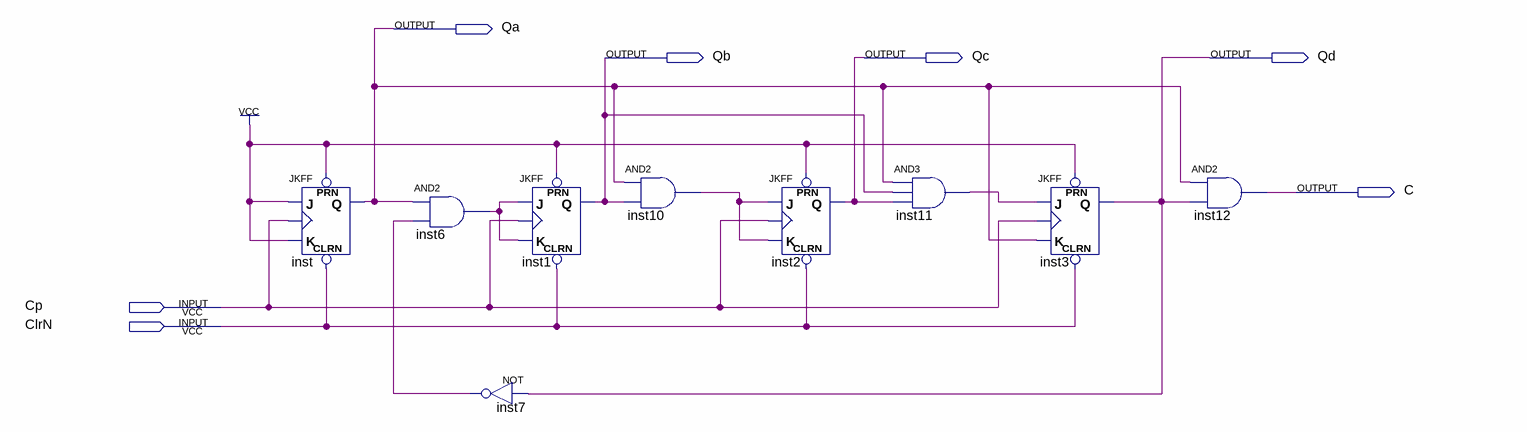
[diagram p0: schematic sheet]
// Quartus schematic BCD_counter.bdf as structural Verilog: 9 symbols, 7 pins
module BCD_counter (
  input  Cp,
  input  ClrN,
  output Qa,
  output Qb,
  output Qc,
  output Qd,
  output C
);

  wire inst6_out, inst7_out, inst10_out, inst11_out;

  JKFF inst (.PRN(1'b1), .CLRN(ClrN), .K(1'b1), .J(1'b1), .CLK(Cp), .Q(Qa));
  and inst6 (inst6_out, Qa, inst7_out);
  not inst7 (inst7_out, Qd);
  JKFF inst1 (.PRN(1'b1), .CLRN(ClrN), .K(inst6_out), .J(inst6_out), .CLK(Cp), .Q(Qb));
  and inst10 (inst10_out, Qa, Qb);
  JKFF inst2 (.PRN(1'b1), .CLRN(ClrN), .K(inst10_out), .J(inst10_out), .CLK(Cp), .Q(Qc));
  and inst11 (inst11_out, Qa, Qb, Qc);
  JKFF inst3 (.PRN(1'b1), .CLRN(ClrN), .K(Qa), .J(inst11_out), .CLK(Cp), .Q(Qd));
  and inst12 (C, Qa, Qd);
endmodule
